# EasyEDA Pro project StepMother2_EasyEDA-Pro-V2_2026-11-12.epro, schematic Schematic1

## Sheets
1 P1: Board Name: Board1; Create Date: 2026-08-29; Page Name: P1; Project Name: Step Sequencer; Schematic Name: Schematic1; Update Date: 2026-08-29; Company: EasyEDA.com; Page Size: A4; Version: V1.0
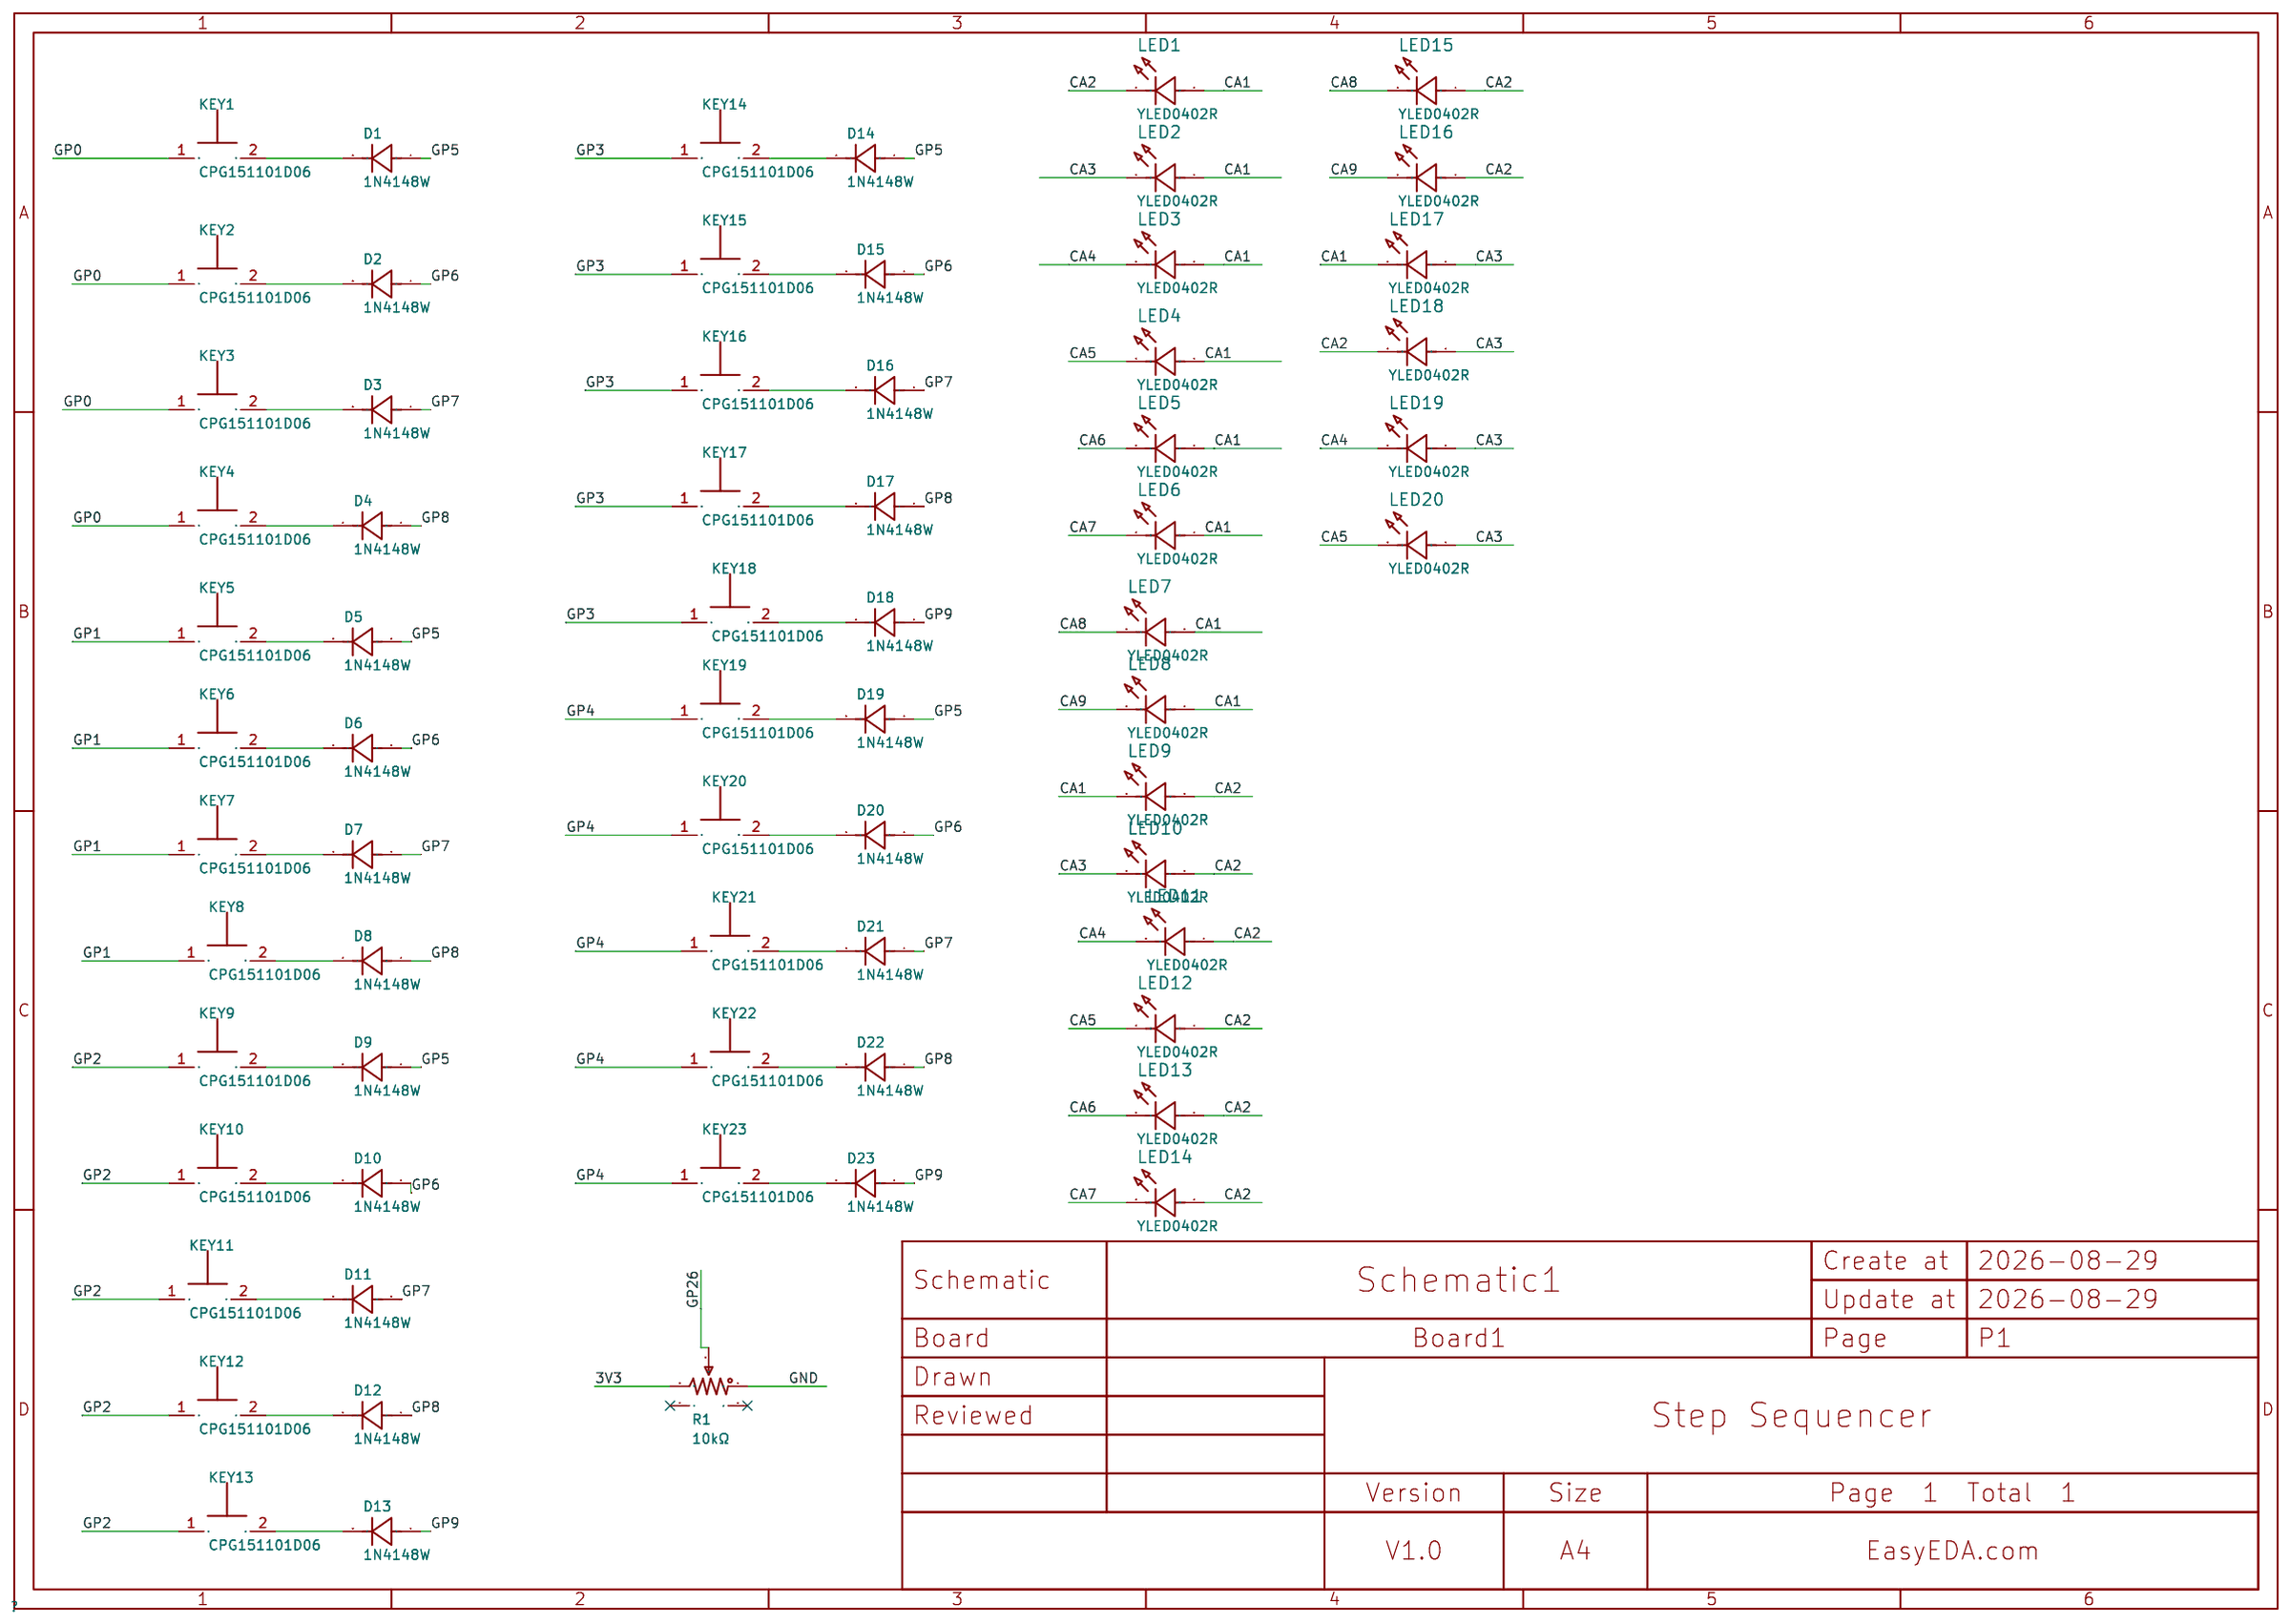
[diagram p0: P1]
2 P2: Create Date: 2026-10-13; Page Name: P2; Project Name: Step Mother RP2040; Update Date: 2026-10-13
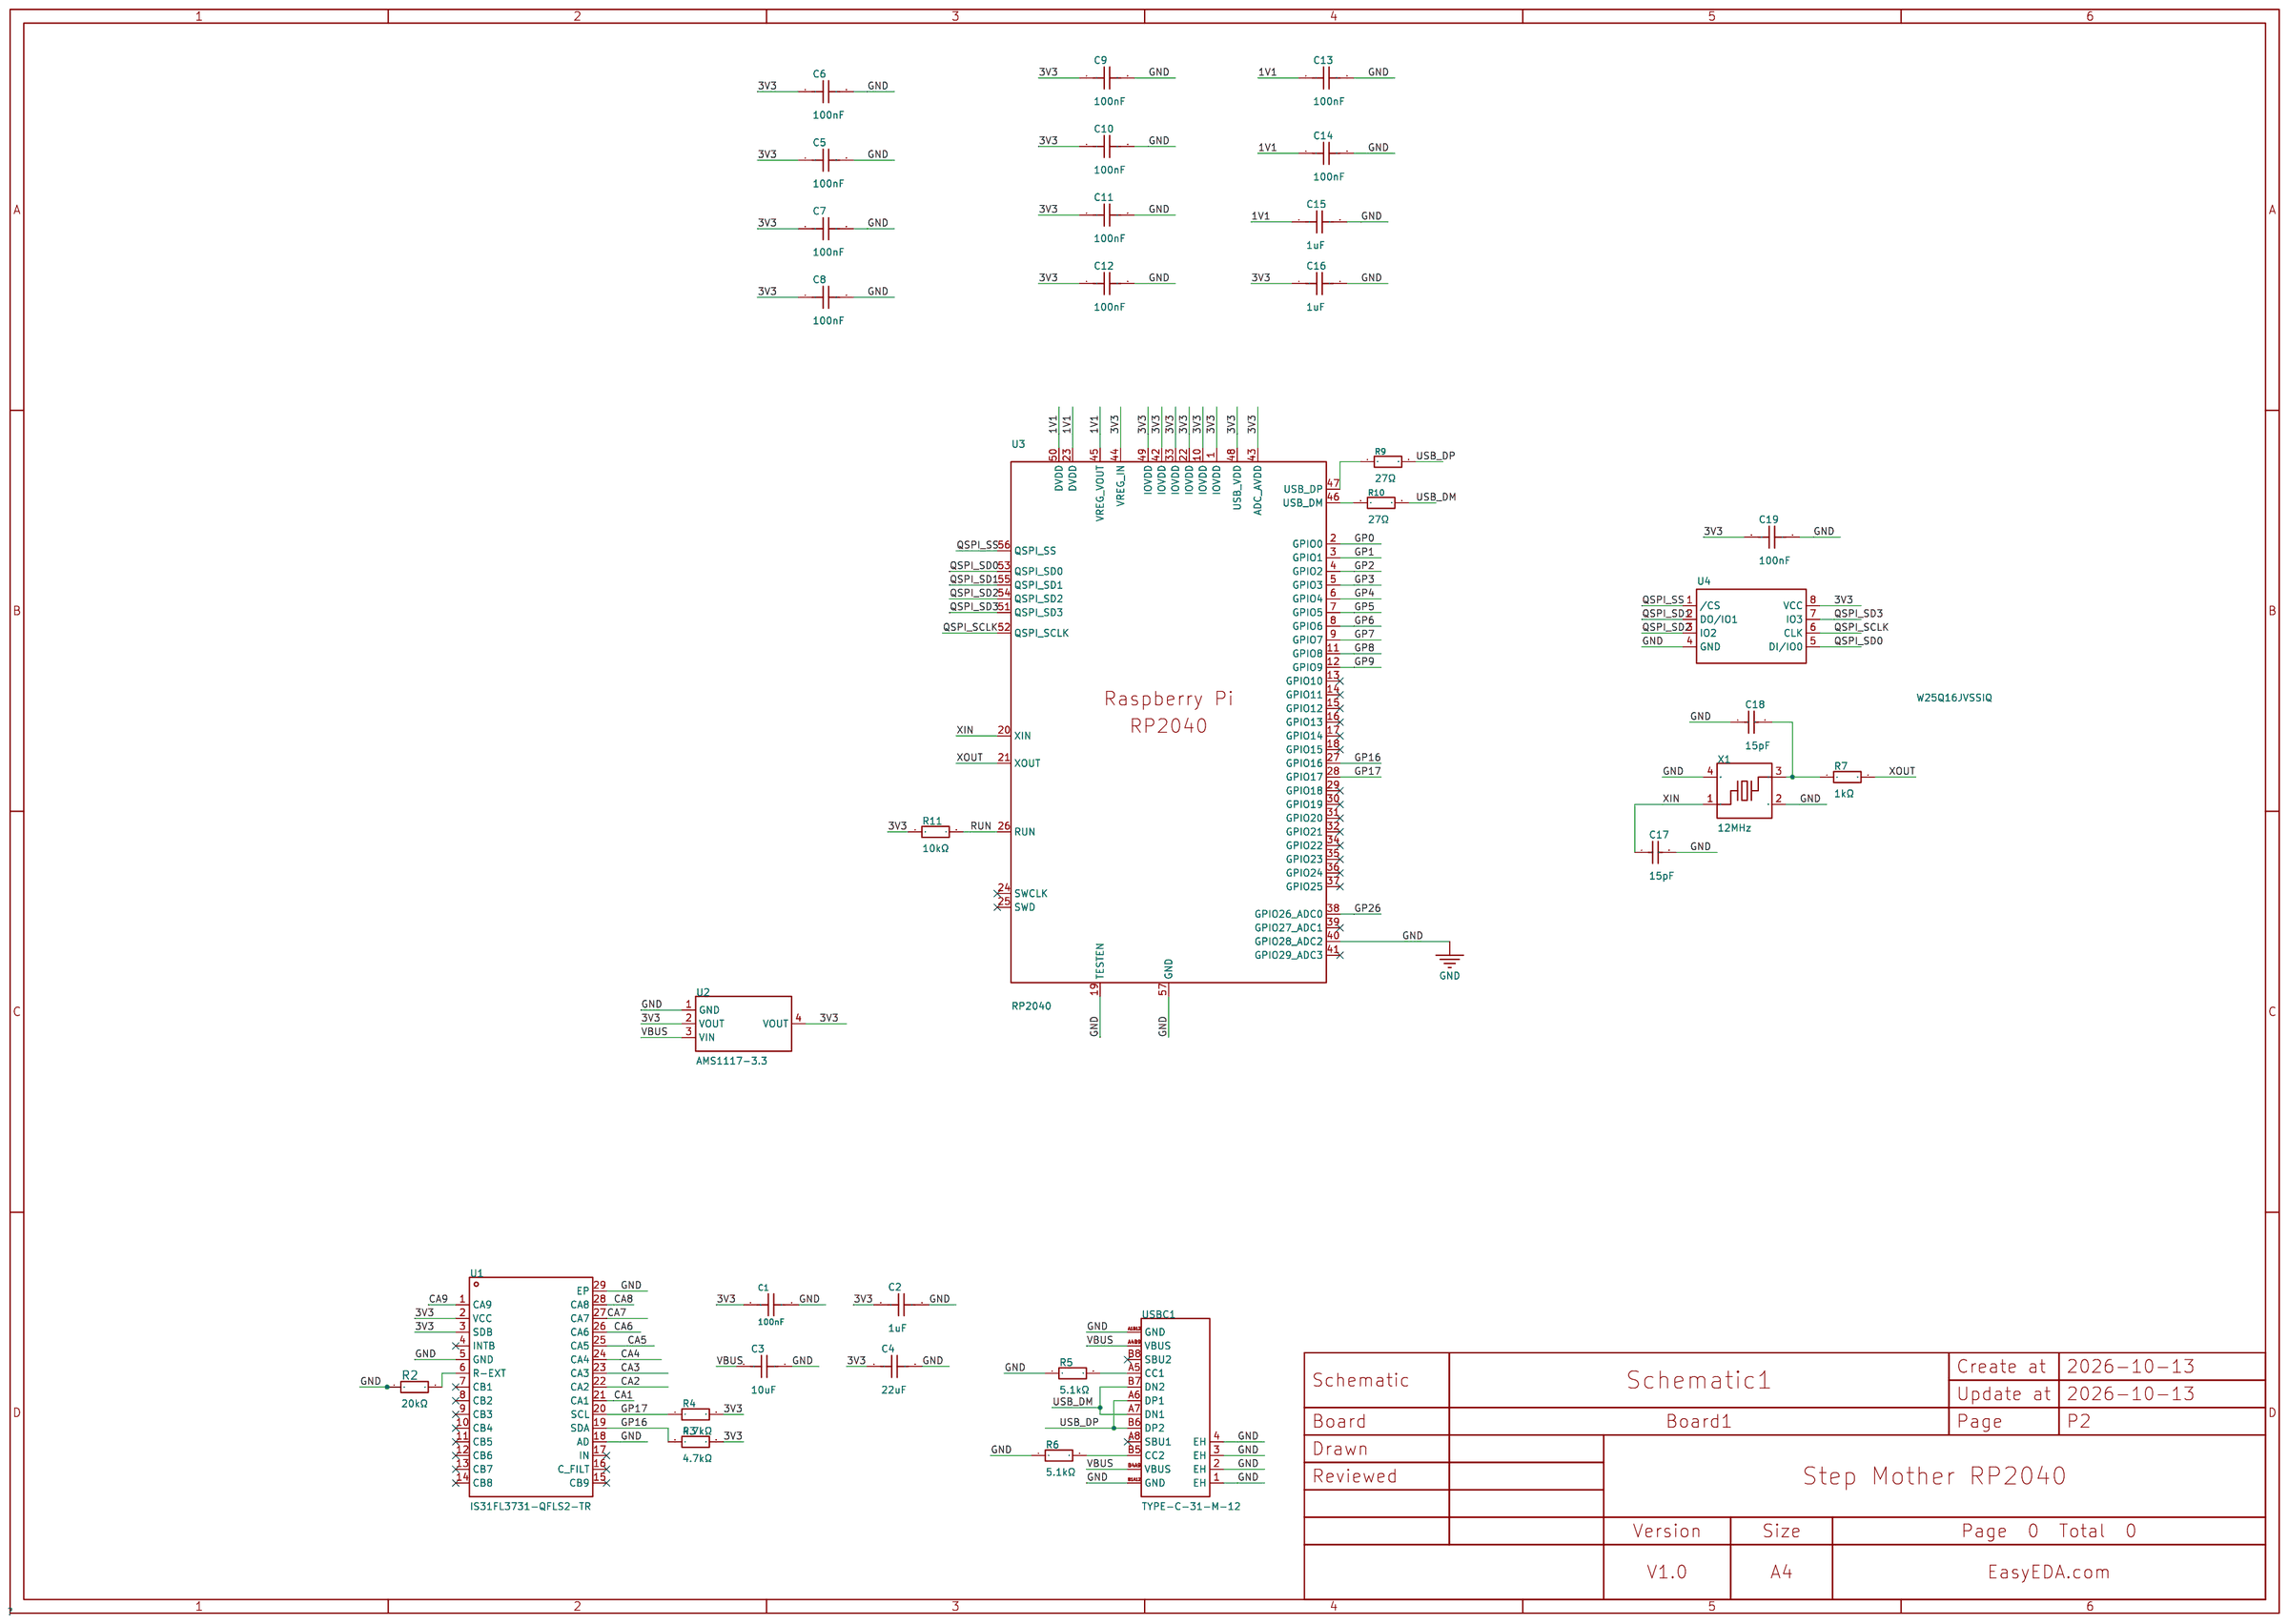
[diagram p1: P2]

## Parts
sheet P1
D1  1N4148W  [SOD-123_L2.7-W1.6-LS3.7-FD]
D2  1N4148W  [SOD-123_L2.7-W1.6-LS3.7-FD]
D3  1N4148W  [SOD-123_L2.7-W1.6-LS3.7-FD]
D4  1N4148W  [SOD-123_L2.7-W1.6-LS3.7-FD]
D5  1N4148W  [SOD-123_L2.7-W1.6-LS3.7-FD]
D6  1N4148W  [SOD-123_L2.7-W1.6-LS3.7-FD]
D7  1N4148W  [SOD-123_L2.7-W1.6-LS3.7-FD]
D8  1N4148W  [SOD-123_L2.7-W1.6-LS3.7-FD]
D9  1N4148W  [SOD-123_L2.7-W1.6-LS3.7-FD]
D10  1N4148W  [SOD-123_L2.7-W1.6-LS3.7-FD]
D11  1N4148W  [SOD-123_L2.7-W1.6-LS3.7-FD]
D12  1N4148W  [SOD-123_L2.7-W1.6-LS3.7-FD]
D13  1N4148W  [SOD-123_L2.7-W1.6-LS3.7-FD]
D14  1N4148W  [SOD-123_L2.7-W1.6-LS3.7-FD]
D15  1N4148W  [SOD-123_L2.7-W1.6-LS3.7-FD]
D16  1N4148W  [SOD-123_L2.7-W1.6-LS3.7-FD]
D17  1N4148W  [SOD-123_L2.7-W1.6-LS3.7-FD]
D18  1N4148W  [SOD-123_L2.7-W1.6-LS3.7-FD]
D19  1N4148W  [SOD-123_L2.7-W1.6-LS3.7-FD]
D20  1N4148W  [SOD-123_L2.7-W1.6-LS3.7-FD]
D21  1N4148W  [SOD-123_L2.7-W1.6-LS3.7-FD]
D22  1N4148W  [SOD-123_L2.7-W1.6-LS3.7-FD]
D23  1N4148W  [SOD-123_L2.7-W1.6-LS3.7-FD]
KEY1  CPG151101D06  [KEY-TH_CPG151101D06]
KEY2  CPG151101D06  [KEY-TH_CPG151101D06]
KEY3  CPG151101D06  [KEY-TH_CPG151101D06]
KEY4  CPG151101D06  [KEY-TH_CPG151101D06]
KEY5  CPG151101D06  [KEY-TH_CPG151101D06]
KEY6  CPG151101D06  [KEY-TH_CPG151101D06]
KEY7  CPG151101D06  [KEY-TH_CPG151101D06]
KEY8  CPG151101D06  [KEY-TH_CPG151101D06]
KEY9  CPG151101D06  [KEY-TH_CPG151101D06]
KEY10  CPG151101D06  [KEY-TH_CPG151101D06]
KEY11  CPG151101D06  [KEY-TH_CPG151101D06]
KEY12  CPG151101D06  [KEY-TH_CPG151101D06]
KEY13  CPG151101D06  [KEY-TH_CPG151101D06]
KEY14  CPG151101D06  [KEY-TH_CPG151101D06]
KEY15  CPG151101D06  [KEY-TH_CPG151101D06]
KEY16  CPG151101D06  [KEY-TH_CPG151101D06]
KEY17  CPG151101D06  [KEY-TH_CPG151101D06]
KEY18  CPG151101D06  [KEY-TH_CPG151101D06]
KEY19  CPG151101D06  [KEY-TH_CPG151101D06]
KEY20  CPG151101D06  [KEY-TH_CPG151101D06]
KEY21  CPG151101D06  [KEY-TH_CPG151101D06]
KEY22  CPG151101D06  [KEY-TH_CPG151101D06]
KEY23  CPG151101D06  [KEY-TH_CPG151101D06]
LED1  YLED0402R  [LED0402-R-RD]
LED2  YLED0402R  [LED0402-R-RD]
LED3  YLED0402R  [LED0402-R-RD]
LED4  YLED0402R  [LED0402-R-RD]
LED5  YLED0402R  [LED0402-R-RD]
LED6  YLED0402R  [LED0402-R-RD]
LED7  YLED0402R  [LED0402-R-RD]
LED8  YLED0402R  [LED0402-R-RD]
LED9  YLED0402R  [LED0402-R-RD]
LED10  YLED0402R  [LED0402-R-RD]
LED11  YLED0402R  [LED0402-R-RD]
LED12  YLED0402R  [LED0402-R-RD]
LED13  YLED0402R  [LED0402-R-RD]
LED14  YLED0402R  [LED0402-R-RD]
LED15  YLED0402R  [LED0402-R-RD]
LED16  YLED0402R  [LED0402-R-RD]
LED17  YLED0402R  [LED0402-R-RD]
LED18  YLED0402R  [LED0402-R-RD]
LED19  YLED0402R  [LED0402-R-RD]
LED20  YLED0402R  [LED0402-R-RD]
R1  10kΩ  [RES-ADJ-TH_RK09L1140A5P]
sheet P2
C1  100nF  [C0603]
C2  1uF  [C0603]
C3  10uF  [C0603]
C4  22uF  [C0805]
C5  100nF  [C0402]
C6  100nF  [C0402]
C7  100nF  [C0402]
C8  100nF  [C0402]
C9  100nF  [C0402]
C10  100nF  [C0402]
C11  100nF  [C0402]
C12  100nF  [C0402]
C13  100nF  [C0402]
C14  100nF  [C0402]
C15  1uF  [C0402]
C16  1uF  [C0402]
C17  15pF  [C0402]
C18  15pF  [C0402]
C19  100nF  [C0402]
R2  20kΩ  [R0603]
R3  4.7kΩ  [R0603]
R4  4.7kΩ  [R0603]
R5  5.1kΩ  [R0603]
R6  5.1kΩ  [R0603]
R7  1kΩ  [R0402]
R9  27Ω  [R0402]
R10  27Ω  [R0402]
R11  10kΩ  [R0402]
U1  IS31FL3731-QFLS2-TR  [QFN-28_L4.0-W4.0-P0.40-BL-EP]
U2  AMS1117-3.3  [SOT-223-3_L6.5-W3.4-P2.30-LS7.0-BR]
U3  RP2040  [LQFN-56_L7.0-W7.0-P0.4-EP]
U4  W25Q16JVSSIQ  [SOIC-8_L5.3-W5.3-P1.27-LS8.0-BL]
USBC1  TYPE-C-31-M-12  [USB-C_SMD-TYPE-C-31-M-12_1]
X1  12MHz  [CRYSTAL-SMD_4P-L3.2-W2.5-BL]

## Library data of the parts
D1-D23 = 1N4148W_C5345962: Diode Configuration:Standalone Pd - Power Dissipation:350mW Current - Rectified:150mA Voltage - DC Reverse(Vr):100V Voltage - Forward(Vf@If):1.25V@150mA Non-Repetitive Peak Forward Surge Current:2A Reverse Leakage Current (Ir):1uA@75V Reverse Recovery Tim; LCSC Part Name: 100V 150mA; Supplier Part: C5345962; Manufacturer: HXY MOSFET(华轩阳电子); Supplier Footprint: SOD-123; JLCPCB Part Class: Extended Part; Datasheet: https://item.szlcsc.com/datasheet/1N4148W/6125799.html; Supplier: LCSC; Diode Configuration: Standalone; Pd - Power Dissipation: 350mW; Current - Rectified: 150mA; Voltage - DC Reverse(Vr): 100V; Voltage - Forward(Vf@If): 1.25V@150mA; Non-Repetitive Peak Forward Surge Current: 2A; Reverse Leakage Current (Ir): 1uA@75V; Reverse Recovery Time (trr): 4ns; Operating Junction Temperature Range: -55℃~+150℃
KEY1-KEY23 = CPG151101D06: Axis Type:Brown Switch Operation Force:45gf Conduction Travel:2mm Voltage Rating:12V Operating Temperature:-40℃~+70℃ Operating Temperature:-40℃~+70℃; LCSC Part Name: 茶轴; Supplier Part: C49234237; Manufacturer: HanElectricity(瀚源); Supplier Footprint: 插件; JLCPCB Part Class: Extended Part; Datasheet: https://item.szlcsc.com/datasheet/CPG151101D06/51650379.html; Supplier: LCSC; Axis Type: Brown Switch; Operation Force: 45gf; Conduction Travel: 2mm; Voltage Rating: 12V; Operating Temperature: -40℃~+70℃
LED1-LED20 = YLED0402R: Lamp Holder Type:- Illumination Color:Red Voltage - Forward(Vf):1.8V~2.4V Voltage - Forward(Vf):1.8V~2.4V Power(Watts):60mW Forward Current:20mA Wavelength - Dominant:615nm~630nm Wavelength - Dominant:615nm~630nm Peak Wavelength:645nm Peak Wavelength:645n; LCSC Part Name: 发光管; Supplier Part: C21260817; Manufacturer: YONGYUTAI(永裕泰); Supplier Footprint: 0402; JLCPCB Part Class: Extended Part; Datasheet: https://item.szlcsc.com/datasheet/YLED0402R/22678288.html; Supplier: LCSC; Illumination Color: Red; Voltage - Forward(Vf): 1.8V~2.4V; Power(Watts): 60mW; Forward Current: 20mA; Wavelength - Dominant: 615nm~630nm; Peak Wavelength: 645nm; Diode Configuration: Discrete Diode; Lens Color: Water Clear; Luminous Intensity: 250mcd; Viewing Angle: 120°; Operating Temperature: -40℃~+85℃
R1 = RK09L1140A5L: Resistance:10kΩ Tolerance:±20% Tolerance:±20% Voltage Rating:10V Power(Watts):50mW; LCSC Part Name: 3件套 旋转电位器（金属轴）; Supplier Part: C7419101; Manufacturer: ALPSALPINE(阿尔卑斯阿尔派); Supplier Footprint: 插件; JLCPCB Part Class: Extended Part; Datasheet: https://item.szlcsc.com/datasheet/RK09L1140A5L/8392216.html; Supplier: LCSC; Tolerance: ±20%; Voltage Rating: 10V; Power(Watts): 50mW
C1 = CC0603KRX7R9BB104: Capacitance:100nF Tolerance:±10% Tolerance:±10% Voltage Rating:50V Temperature Coefficient:X7R; LCSC Part Name: 100nF ±10% 50V; Supplier Part: C14663; Manufacturer: YAGEO(国巨); Supplier Footprint: 0603; JLCPCB Part Class: Basic Part; Datasheet: https://item.szlcsc.com/datasheet/CC0603KRX7R9BB104/15331.html; Supplier: LCSC; Tolerance: ±10%; Voltage Rating: 50V; Temperature Coefficient: X7R
C2 = CL10A105KB8NNNC: Capacitance:1uF Tolerance:±10% Tolerance:±10% Voltage Rating:50V Temperature Coefficient:X5R; LCSC Part Name: 1uF ±10% 50V; Supplier Part: C15849; Manufacturer: SAMSUNG(三星); Supplier Footprint: 0603; JLCPCB Part Class: Basic Part; Datasheet: https://item.szlcsc.com/datasheet/CL10A105KB8NNNC/16531.html; Supplier: LCSC; Tolerance: ±10%; Voltage Rating: 50V; Temperature Coefficient: X5R
C3 = CL10A106KP8NNNC: Capacitance:10uF Tolerance:±10% Tolerance:±10% Voltage Rating:10V Temperature Coefficient:X5R; LCSC Part Name: 10uF ±10% 10V; Supplier Part: C19702; Manufacturer: SAMSUNG(三星); Supplier Footprint: 0603; JLCPCB Part Class: Basic Part; Datasheet: https://item.szlcsc.com/datasheet/CL10A106KP8NNNC/20411.html; Supplier: LCSC; Tolerance: ±10%; Voltage Rating: 10V; Temperature Coefficient: X5R
C4 = CL21A226MAQNNNE: Capacitance:22uF Tolerance:±20% Tolerance:±20% Voltage Rating:25V Temperature Coefficient:X5R; LCSC Part Name: 22uF ±20% 25V; Supplier Part: C45783; Manufacturer: SAMSUNG(三星); Supplier Footprint: 0805; JLCPCB Part Class: Basic Part; Datasheet: https://item.szlcsc.com/datasheet/CL21A226MAQNNNE/46786.html; Supplier: LCSC; Tolerance: ±20%; Voltage Rating: 25V; Temperature Coefficient: X5R
C5-C14 C19 = CL05B104KO5NNNC: Capacitance:100nF Tolerance:±10% Tolerance:±10% Voltage Rating:16V Temperature Coefficient:X7R; LCSC Part Name: 100nF ±10% 16V; Supplier Part: C1525; Manufacturer: SAMSUNG(三星); Supplier Footprint: 0402; JLCPCB Part Class: Basic Part; Datasheet: https://item.szlcsc.com/datasheet/CL05B104KO5NNNC/1877.html; Supplier: LCSC; Tolerance: ±10%; Voltage Rating: 16V; Temperature Coefficient: X7R
C15 C16 = CL05A105KA5NQNC: Capacitance:1uF Tolerance:±10% Tolerance:±10% Voltage Rating:25V Temperature Coefficient:X5R; LCSC Part Name: 1uF ±10% 25V; Supplier Part: C52923; Manufacturer: SAMSUNG(三星); Supplier Footprint: 0402; JLCPCB Part Class: Basic Part; Datasheet: https://item.szlcsc.com/datasheet/CL05A105KA5NQNC/53938.html; Supplier: LCSC; Tolerance: ±10%; Voltage Rating: 25V; Temperature Coefficient: X5R
C17 C18 = 0402CG150J500NT: Capacitance:15pF Tolerance:±5% Tolerance:±5% Voltage Rating:50V Temperature Coefficient:C0G; LCSC Part Name: 15pF ±5% 50V; Supplier Part: C1548; Manufacturer: FH(风华); Supplier Footprint: 0402; JLCPCB Part Class: Basic Part; Datasheet: https://item.szlcsc.com/datasheet/0402CG150J500NT/1900.html; Supplier: LCSC; Tolerance: ±5%; Voltage Rating: 50V; Temperature Coefficient: C0G
R2 = 0603WAF2002T5E: Type:Thick Film Resistor Resistance:20kΩ Tolerance:±1% Tolerance:±1% Power(Watts):100mW Voltage-Supply(Max):75V Temperature Coefficient:±100ppm/℃ Temperature Coefficient:±100ppm/℃ Operating Temperature:-55℃~+155℃ Operating Temperature:-55℃~+155℃; LCSC Part Name: 厚膜电阻 20kΩ ±1%; Supplier Part: C4184; Manufacturer: UNI-ROYAL(厚声); Supplier Footprint: 0603; JLCPCB Part Class: Basic Part; Datasheet: https://item.szlcsc.com/datasheet/0603WAF2002T5E/4591.html; Supplier: LCSC; Type: Thick Film Resistor; Tolerance: ±1%; Power(Watts): 100mW; Voltage-Supply(Max): 75V; Temperature Coefficient: ±100ppm/℃; Operating Temperature: -55℃~+155℃
R3 R4 = 0603WAF4701T5E: Type:Thick Film Resistor Resistance:4.7kΩ Tolerance:±1% Tolerance:±1% Power(Watts):100mW Voltage-Supply(Max):75V Temperature Coefficient:±100ppm/℃ Temperature Coefficient:±100ppm/℃ Operating Temperature:-55℃~+155℃ Operating Temperature:-55℃~+155℃; LCSC Part Name: 厚膜电阻 4.7kΩ ±1%; Supplier Part: C23162; Manufacturer: UNI-ROYAL(厚声); Supplier Footprint: 0603; JLCPCB Part Class: Basic Part; Datasheet: https://item.szlcsc.com/datasheet/0603WAF4701T5E/23889.html; Supplier: LCSC; Type: Thick Film Resistor; Tolerance: ±1%; Power(Watts): 100mW; Voltage-Supply(Max): 75V; Temperature Coefficient: ±100ppm/℃; Operating Temperature: -55℃~+155℃
R5 R6 = 0603WAF5101T5E: Type:Thick Film Resistor Resistance:5.1kΩ Tolerance:±1% Tolerance:±1% Power(Watts):100mW Voltage-Supply(Max):75V Temperature Coefficient:±100ppm/℃ Temperature Coefficient:±100ppm/℃ Operating Temperature:-55℃~+155℃ Operating Temperature:-55℃~+155℃; LCSC Part Name: 厚膜电阻 5.1kΩ ±1%; Supplier Part: C23186; Manufacturer: UNI-ROYAL(厚声); Supplier Footprint: 0603; JLCPCB Part Class: Basic Part; Datasheet: https://item.szlcsc.com/datasheet/0603WAF5101T5E/23913.html; Supplier: LCSC; Type: Thick Film Resistor; Tolerance: ±1%; Power(Watts): 100mW; Voltage-Supply(Max): 75V; Temperature Coefficient: ±100ppm/℃; Operating Temperature: -55℃~+155℃
R7 = 0402WGF1001TCE: Type:Thick Film Resistor Resistance:1kΩ Tolerance:±1% Tolerance:±1% Power(Watts):62.5mW Voltage-Supply(Max):50V Temperature Coefficient:±100ppm/℃ Temperature Coefficient:±100ppm/℃ Operating Temperature:-55℃~+155℃ Operating Temperature:-55℃~+155℃; LCSC Part Name: 厚膜电阻 1kΩ ±1%; Supplier Part: C11702; Manufacturer: UNI-ROYAL(厚声); Supplier Footprint: 0402; JLCPCB Part Class: Basic Part; Datasheet: https://item.szlcsc.com/datasheet/0402WGF1001TCE/12256.html; Supplier: LCSC; Type: Thick Film Resistor; Tolerance: ±1%; Power(Watts): 62.5mW; Voltage-Supply(Max): 50V; Temperature Coefficient: ±100ppm/℃; Operating Temperature: -55℃~+155℃
R9 R10 = 0402WGJ0270TCE: Type:Thick Film Resistor Resistance:27Ω Tolerance:±5% Tolerance:±5% Power(Watts):62.5mW Voltage-Supply(Max):50V Temperature Coefficient:±100ppm/℃ Temperature Coefficient:±100ppm/℃ Operating Temperature:-55℃~+155℃ Operating Temperature:-55℃~+155℃; LCSC Part Name: 厚膜电阻 27Ω ±5%; Supplier Part: C25156; Manufacturer: UNI-ROYAL(厚声); Supplier Footprint: 0402; JLCPCB Part Class: Extended Part; Datasheet: https://item.szlcsc.com/datasheet/0402WGJ0270TCE/25899.html; Supplier: LCSC; Type: Thick Film Resistor; Tolerance: ±5%; Power(Watts): 62.5mW; Voltage-Supply(Max): 50V; Temperature Coefficient: ±100ppm/℃; Operating Temperature: -55℃~+155℃
R11 = 0402WGF1002TCE: Type:Thick Film Resistor Resistance:10kΩ Tolerance:±1% Tolerance:±1% Power(Watts):62.5mW Voltage-Supply(Max):50V Temperature Coefficient:±100ppm/℃ Temperature Coefficient:±100ppm/℃ Operating Temperature:-55℃~+155℃ Operating Temperature:-55℃~+155℃; LCSC Part Name: 厚膜电阻 10kΩ ±1%; Supplier Part: C25744; Manufacturer: UNI-ROYAL(厚声); Supplier Footprint: 0402; JLCPCB Part Class: Basic Part; Datasheet: https://item.szlcsc.com/datasheet/0402WGF1002TCE/26487.html; Supplier: LCSC; Type: Thick Film Resistor; Tolerance: ±1%; Power(Watts): 62.5mW; Voltage-Supply(Max): 50V; Temperature Coefficient: ±100ppm/℃; Operating Temperature: -55℃~+155℃
U1 = IS31FL3731-QFLS2-TR: Voltage - Input(DC):2.7V~5.5V Voltage - Input(DC):2.7V~5.5V Dimming:PWM Operating temperature:-40℃~+85℃ Operating temperature:-40℃~+85℃ Switch Tube (Built-In/External):Built-in; LCSC Part Name: 音频调制矩阵LED驱动器; Supplier Part: C191206; Manufacturer: ISSI(北京矽成); Supplier Footprint: QFN-28-EP(4x4); JLCPCB Part Class: Extended Part; Datasheet: https://item.szlcsc.com/datasheet/IS31FL3731-QFLS2-TR/214396.html; Supplier: LCSC; Voltage - Input(DC): 2.7V~5.5V; Dimming: PWM; Operating temperature: -40℃~+85℃; Switch Tube (Built-In/External): Built-in
U2 = AMS1117-3.3_C6186: Output Configuration:Positive Voltage - Supply:15V Output Voltage:3.3V Output Voltage:3.3V Output Current:1A Power Supply Rejection Ratio (PSRR):72dB@(120Hz) Voltage Dropout:1.1V@(800mA) standby current:5mA Noise:0.003%Vout Features:Short Circuit Protecti; LCSC Part Name: 3.3V 1A 15V; Supplier Part: C6186; Manufacturer: Advanced Monolithic Systems; Supplier Footprint: SOT-223; JLCPCB Part Class: Basic Part; Datasheet: https://item.szlcsc.com/datasheet/AMS1117-3.3/6652.html; Supplier: LCSC; Output Configuration: Positive; Voltage - Supply: 15V; Output Voltage: 3.3V; Output Current: 1A; Power Supply Rejection Ratio (PSRR): 72dB@(120Hz); Voltage Dropout: 1.1V@(800mA); standby current: 5mA; Noise: 0.003%Vout; Features: Short Circuit Protection；Thermal shutdown；Over Current Protection; Operating Temperature: -40℃~+125℃; Output Type: Fixed; Number of Outputs: 1
U3 = RP2040_C2040: CPU Core:ARM Cortex-M0+ CPU Maximum Speed:133MHz Core Size:32 Bit Program Memory Type:External RAM Size:264KB Number of I/O:30 ADC (Bit):12bit Oscillator Type:Built-in+External Voltage - Supply:1.8V~3.3V Voltage - Supply:1.8V~3.3V Operating Temperature:-2; LCSC Part Name: SC0914(13); Supplier Part: C2040; Manufacturer: Raspberry Pi(树莓派); Supplier Footprint: LQFN-56(7x7); JLCPCB Part Class: Extended Part; Datasheet: https://item.szlcsc.com/datasheet/RP2040/2392.html; Supplier: LCSC; CPU Core: ARM Cortex-M0+; CPU Maximum Speed: 133MHz; Core Size: 32 Bit; Program Memory Type: External; RAM Size: 264KB; Number of I/O: 30; ADC (Bit): 12bit; Oscillator Type: Built-in+External; Voltage - Supply: 1.8V~3.3V; Operating Temperature: -20℃~+85℃
U4 = W25Q16JVSSIQ: Interface:SPI Memory Size:16Mbit Clock Frequency:133MHz Voltage - Supply:2.7V~3.6V Voltage - Supply:2.7V~3.6V Standby Supply Current:10uA Program / Erase Cycles:100,000 cycles Write Cycle Time (tWC):- Page Programming Time (Tpp):3ms Block Erase Time(tBE):; LCSC Part Name: 支持双/四路SPI接口的3V、16Mbit 串行闪存; Supplier Part: C131025; Manufacturer: Winbond(华邦); Supplier Footprint: SOIC-8-208mil; JLCPCB Part Class: Extended Part; Datasheet: https://item.szlcsc.com/datasheet/W25Q16JVSSIQ/142317.html; Supplier: LCSC; Interface: SPI; Memory Size: 16Mbit; Clock Frequency: 133MHz; Voltage - Supply: 2.7V~3.6V; Standby Supply Current: 10uA; Program / Erase Cycles: 100,000 cycles; Page Programming Time (Tpp): 3ms; Data Retention - TDR (Year): 20 Years; Operating Temperature: -40℃~+85℃; Features: Hardware write protection；Absolute write protection；Write enable latch；Software write protection；Power-on reset
USBC1 = TYPE-C-31-M-12: Connector Type:Type-C Protocol Standard:- Gender:Female Mounting Type:Surface Mount, Right Angle Number of Contacts:16P Number of Ports:1 Current Rating-Power:5A Voltage Rating:20V Connect-Disconnect Life:10,000 cycles Length:7.35mm Operating Temperature:; LCSC Part Name: Type-C 母 卧贴; Supplier Part: C165948; Manufacturer: 韩国韩荣; Supplier Footprint: SMD; JLCPCB Part Class: Extended Part; Datasheet: https://item.szlcsc.com/datasheet/TYPE-C-31-M-12/177331.html; Supplier: LCSC; Connector Type: Type-C; Gender: Female; Mounting Type: Surface Mount, Right Angle; Number of Contacts: 16P; Number of Ports: 1; Current Rating-Power: 5A; Voltage Rating: 20V; Connect-Disconnect Life: 10,000 cycles; Length: 7.35mm; Operating Temperature: -30℃~+80℃
X1 = ABM8-272-T3_C20625731: Type:Crystal Oscillator Frequency:12MHz Normal temperature Frequency Tolerance:±30ppm Normal temperature Frequency Tolerance:±30ppm Load Capacitance:10pF Frequency Stability:±30ppm Frequency Stability:±30ppm Equivalent Series Resistance(ESR):50Ω Operating; LCSC Part Name: 12MHz ±30ppm 10pF; Supplier Part: C20625731; Manufacturer: ABRACON; Manufacturer Part: ABM8-272-T3; Supplier Footprint: SMD3225-4P; JLCPCB Part Class: Extended Part; Datasheet: https://item.szlcsc.com/datasheet/ABM8-272-T3/22032038.html; Supplier: LCSC; Type: Crystal Oscillator; Normal temperature Frequency Tolerance: ±30ppm; Load Capacitance: 10pF; Frequency Stability: ±30ppm; Equivalent Series Resistance(ESR): 50Ω; Operating Temperature: -40℃~+85℃

## Nets
1V1: C13.1 C14.1 C15.1 U3.23(DVDD) U3.45(VREG_VOUT) U3.50(DVDD)
3V3: C1.1 C2.1 C4.1 C5.1 C6.1 C7.1 C8.1 C9.1 C10.1 C11.1 C12.1 C16.1 C19.1 R1.3 R3.2 R4.2 R11.1 U1.2(VCC) U1.3(SDB) U2.2(VOUT) U2.4(VOUT) U3.1(IOVDD) U3.10(IOVDD) U3.22(IOVDD) U3.33(IOVDD) U3.42(IOVDD) U3.43(ADC_AVDD) U3.44(VREG_IN) U3.48(USB_VDD) U3.49(IOVDD) U4.8(VCC)
GND: C1.2 C2.2 C3.2 C4.2 C5.2 C6.2 C7.2 C8.2 C9.2 C10.2 C11.2 C12.2 C13.2 C14.2 C15.2 C16.2 C17.2 C18.1 C19.2 R1.1 R2.1 R5.1 R6.1 U1.5(GND) U1.18(AD) U1.29(EP) U2.1(GND) U3.19(TESTEN) U3.40(GPIO28_ADC2) U3.57(GND) U4.4(GND) USBC1.1(EH) USBC1.2(EH) USBC1.3(EH) USBC1.4(EH) USBC1.A1B12(GND) USBC1.B1A12(GND) X1.2(GND) X1.4(GND)
VBUS: C3.1 U2.3(VIN) USBC1.A4B9(VBUS) USBC1.B4A9(VBUS)
CA1: LED1.1(A) LED2.1(A) LED3.1(A) LED4.1(A) LED5.1(A) LED6.1(A) LED7.1(A) LED8.1(A) LED9.2(K) LED17.2(K) U1.21(CA1)
CA2: LED1.2(K) LED9.1(A) LED10.1(A) LED11.1(A) LED12.1(A) LED13.1(A) LED14.1(A) LED15.1(A) LED16.1(A) LED18.2(K) U1.22(CA2)
CA3: LED2.2(K) LED10.2(K) LED17.1(A) LED18.1(A) LED19.1(A) LED20.1(A) U1.23(CA3)
CA4: LED3.2(K) LED11.2(K) LED19.2(K) U1.24(CA4)
CA5: LED4.2(K) LED12.2(K) LED20.2(K) U1.25(CA5)
CA6: LED5.2(K) LED13.2(K) U1.26(CA6)
CA7: LED6.2(K) LED14.2(K) U1.27(CA7)
CA8: LED7.2(K) LED15.2(K) U1.28(CA8)
CA9: LED8.2(K) LED16.2(K) U1.1(CA9)
GP0: KEY1.1 KEY2.1 KEY3.1 KEY4.1 U3.2(GPIO0)
GP1: KEY5.1 KEY6.1 KEY7.1 KEY8.1 U3.3(GPIO1)
GP2: KEY9.1 KEY10.1 KEY11.1 KEY12.1 KEY13.1 U3.4(GPIO2)
GP3: KEY14.1 KEY15.1 KEY16.1 KEY17.1 KEY18.1 U3.5(GPIO3)
GP4: KEY19.1 KEY20.1 KEY21.1 KEY22.1 KEY23.1 U3.6(GPIO4)
GP5: D1.1(+) D5.1(+) D9.1(+) D14.1(+) D19.1(+) U3.7(GPIO5)
GP6: D2.1(+) D6.1(+) D10.1(+) D15.1(+) D20.1(+) U3.8(GPIO6)
GP7: D3.1(+) D7.1(+) D11.1(+) D16.1(+) D21.1(+) U3.9(GPIO7)
GP8: D4.1(+) D8.1(+) D12.1(+) D17.1(+) D22.1(+) U3.11(GPIO8)
GP9: D13.1(+) D18.1(+) D23.1(+) U3.12(GPIO9)
GP16: R3.1 U1.19(SDA) U3.27(GPIO16)
GP17: R4.1 U1.20(SCL) U3.28(GPIO17)
GP26: R1.2 U3.38(GPIO26_ADC0)
QSPI_SCLK: U3.52(QSPI_SCLK) U4.6(CLK)
QSPI_SD0: U3.53(QSPI_SD0) U4.5(DI/IO0)
QSPI_SD1: U3.55(QSPI_SD1) U4.2(DO/IO1)
QSPI_SD2: U3.54(QSPI_SD2) U4.3(IO2)
QSPI_SD3: U3.51(QSPI_SD3) U4.7(IO3)
QSPI_SS: U3.56(QSPI_SS) U4.1(/CS)
RUN: R11.2 U3.26(RUN)
USB_DM: R10.2 USBC1.A7(DN1) USBC1.B7(DN2)
USB_DP: R9.2 USBC1.A6(DP1) USBC1.B6(DP2)
XIN: C17.1 U3.20(XIN) X1.1
XOUT: R7.2 U3.21(XOUT)
$1N4: D1.2(-) KEY1.2
$1N5: D2.2(-) KEY2.2
$1N7: D3.2(-) KEY3.2
$1N9: D4.2(-) KEY4.2
$1N13: D5.2(-) KEY5.2
$1N15: D6.2(-) KEY6.2
$1N17: D7.2(-) KEY7.2
$1N19: D8.2(-) KEY8.2
$1N21: D9.2(-) KEY9.2
$1N23: D10.2(-) KEY10.2
$1N25: D11.2(-) KEY11.2
$1N27: D12.2(-) KEY12.2
$1N29: D13.2(-) KEY13.2
$1N31: D14.2(-) KEY14.2
$1N33: D15.2(-) KEY15.2
$1N35: D16.2(-) KEY16.2
$1N37: D17.2(-) KEY17.2
$1N39: D18.2(-) KEY18.2
$1N41: D19.2(-) KEY19.2
$1N43: D20.2(-) KEY20.2
$1N45: D21.2(-) KEY21.2
$1N47: D22.2(-) KEY22.2
$1N49: D23.2(-) KEY23.2
$2N73: R2.2 U1.6(R-EXT)
$2N145: R5.2 USBC1.A5(CC1)
$2N147: R6.2 USBC1.B5(CC2)
$2N201: C18.2 R7.1 X1.3
$2N222: R9.1 U3.47(USB_DP)
$2N223: R10.1 U3.46(USB_DM)

Not connected (* = marked no-connect by the designer): R1 4* 5*; U1 4(INTB)* 7(CB1)* 8(CB2)* 9(CB3)* 10(CB4)* 11(CB5)* 12(CB6)* 13(CB7)* 14(CB8)* 15(CB9)* 16(C_FILT)* 17(IN)*; U3 13(GPIO10)* 14(GPIO11)* 15(GPIO12)* 16(GPIO13)* 17(GPIO14)* 18(GPIO15)* 24(SWCLK)* 25(SWD)* 29(GPIO18)* 30(GPIO19)* 31(GPIO20)* 32(GPIO21)* 34(GPIO22)* 35(GPIO23)* 36(GPIO24)* 37(GPIO25)* 39(GPIO27_ADC1)* 41(GPIO29_ADC3)*; USBC1 A8(SBU1)* B8(SBU2)*
